# Altium schematic sheet STM32 Sematik.SchDoc
size A4; SheetNumber: 3; SheetTotal: 7
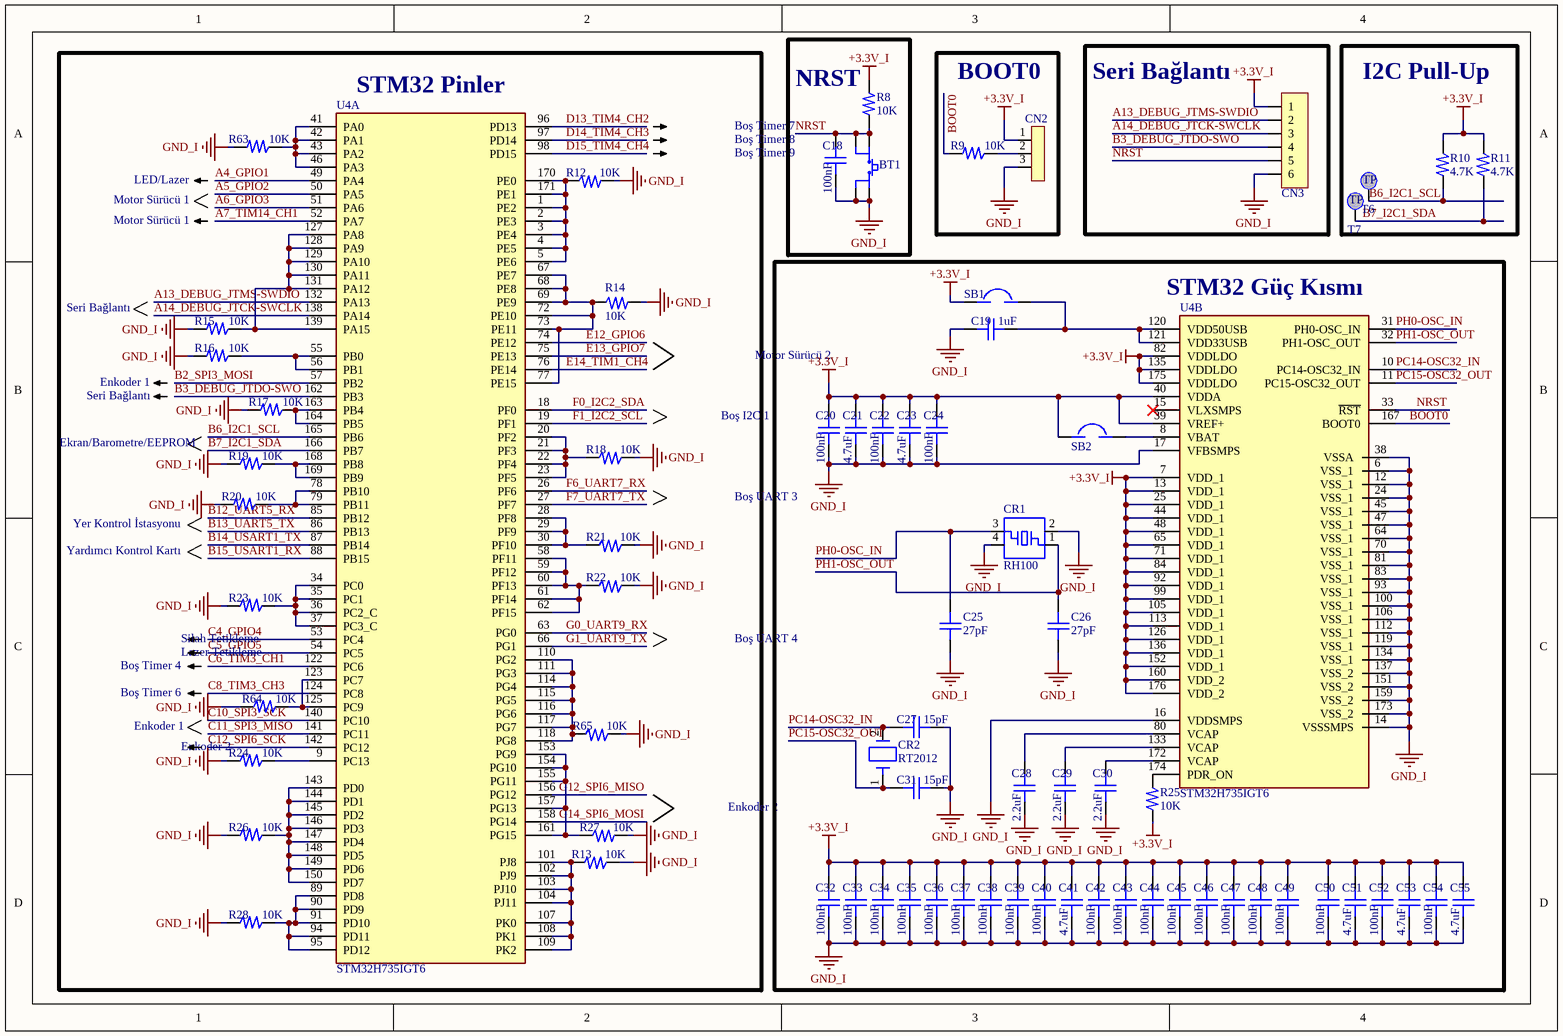
[diagram p0: STM32 Sematik.SchDoc]

## Parts
BT1  5_mm_Buton  [5mm_buton]  (value not drawn)
C18  100nF  [0805 Kapasıtor]
C19  1uF  [0805 Kapasıtor]
C20  100nF  [0805 Kapasıtor]
C21  4.7uF  [0805 Kapasıtor]
C22  100nF  [0805 Kapasıtor]
C23  4.7uF  [0805 Kapasıtor]
C24  100nF  [0805 Kapasıtor]
C25  27pF  [0805 Kapasıtor]
C26  27pF  [0805 Kapasıtor]
C27  15pF  [0805 Kapasıtor]
C28  2.2uF  [0805 Kapasıtor]
C29  2.2uF  [0805 Kapasıtor]
C30  2.2uF  [0805 Kapasıtor]
C31  15pF  [0805 Kapasıtor]
C32  100nF  [0805 Kapasıtor]
C33  100nF  [0805 Kapasıtor]
C34  100nF  [0805 Kapasıtor]
C35  100nF  [0805 Kapasıtor]
C36  100nF  [0805 Kapasıtor]
C37  100nF  [0805 Kapasıtor]
C38  100nF  [0805 Kapasıtor]
C39  100nF  [0805 Kapasıtor]
C40  100nF  [0805 Kapasıtor]
C41  4.7uF  [0805 Kapasıtor]
C42  100nF  [0805 Kapasıtor]
C43  100nF  [0805 Kapasıtor]
C44  100nF  [0805 Kapasıtor]
C45  100nF  [0805 Kapasıtor]
C46  100nF  [0805 Kapasıtor]
C47  100nF  [0805 Kapasıtor]
C48  100nF  [0805 Kapasıtor]
C49  100nF  [0805 Kapasıtor]
C50  100nF  [0805 Kapasıtor]
C51  4.7uF  [0805 Kapasıtor]
C52  100nF  [0805 Kapasıtor]
C53  4.7uF  [0805 Kapasıtor]
C54  100nF  [0805 Kapasıtor]
C55  4.7uF  [0805 Kapasıtor]
CN2  3_Pin_Header  [3_PIN_HEADER]  (value not drawn)
CN3  6_Pin_JST_Male  [6_Pin_JST_Male]  (value not drawn)
CR1  RH100  [RH100]
CR2  RT2012  [RT2012]
R8  10K  [0805 Dırenc]
R9  10K  [0805 Dırenc]
R10  4.7K  [0805 Dırenc]
R11  4.7K  [0805 Dırenc]
R12  10K  [0805 Dırenc]
R13  10K  [0805 Dırenc]
R14  10K  [0805 Dırenc]
R15  10K  [0805 Dırenc]
R16  10K  [0805 Dırenc]
R17  10K  [0805 Dırenc]
R18  10K  [0805 Dırenc]
R19  10K  [0805 Dırenc]
R20  10K  [0805 Dırenc]
R21  10K  [0805 Dırenc]
R22  10K  [0805 Dırenc]
R23  10K  [0805 Dırenc]
R24  10K  [0805 Dırenc]
R25  10K  [0805 Dırenc]
R26  10K  [0805 Dırenc]
R27  10K  [0805 Dırenc]
R28  10K  [0805 Dırenc]
R63  10K  [0805 Dırenc]
R64  10K  [0805 Dırenc]
R65  10K  [0805 Dırenc]
SB1  Solder_Bridge  [Solder_Bridge]  (value not drawn)
SB2  Solder_Bridge  [Solder_Bridge]  (value not drawn)
T6  Test Noktası  [Test Noktası]  (value not drawn)
T7  Test Noktası  [Test Noktası]  (value not drawn)
U4  STM32H735IGT6  [LQFP-176]  (parts A,B of 2)

## Blocks framed on the sheet
STM32 Pinler: R12-R24 R26-R28 R63-R65 U4
NRST: BT1 C18 R8
BOOT0: CN2 R9
Seri Bağlantı: CN3
I2C Pull-Up: R10 R11 T6 T7
STM32 Güç Kısmı: C19-C55 CR1 CR2 R25 SB1 SB2 U4

## Nets
+3.3V_I: C20.2 C21.2 C22.2 C23.2 C24.2 C32.2 C33.2 C34.2 C35.2 C36.2 C37.2 C38.2 C39.2 C40.2 C41.2 C42.2 C43.2 C44.2 C45.2 C46.2 C47.2 C48.2 C49.2 C50.2 C51.2 C52.2 C53.2 C54.2 C55.2 CN2.1 CN3.1 R8.2 R10.2 R11.2 R25.1 SB1.1 SB2.1 U4.7(VDD_1) U4.13(VDD_1) U4.25(VDD_1) U4.39(VREF+) U4.40(VDDA) U4.44(VDD_1) U4.48(VDD_1) U4.65(VDD_1) U4.71(VDD_1) U4.82(VDDLDO) U4.84(VDD_1) U4.92(VDD_1) U4.99(VDD_1) U4.105(VDD_1) U4.113(VDD_1) U4.126(VDD_1) U4.135(VDDLDO) U4.136(VDD_1) U4.152(VDD_1) U4.160(VDD_2) U4.175(VDDLDO) U4.176(VDD_2)
GND_I: BT1.2 BT1.3 C18.1 C19.1 C20.1 C21.1 C22.1 C23.1 C24.1 C25.1 C26.1 C27.2 C28.1 C29.1 C30.1 C31.2 C32.1 C33.1 C34.1 C35.1 C36.1 C37.1 C38.1 C39.1 C40.1 C41.1 C42.1 C43.1 C44.1 C45.1 C46.1 C47.1 C48.1 C49.1 C50.1 C51.1 C52.1 C53.1 C54.1 C55.1 CN2.3 CN3.6 CR1.2 CR1.4 R12.1 R13.1 R14.1 R15.1 R16.1 R17.1 R18.1 R19.1 R20.1 R21.1 R22.1 R23.1 R24.1 R26.1 R27.1 R28.1 R63.1 R64.1 R65.1 U4.6(VSS_1) U4.12(VSS_1) U4.14(VSSSMPS) U4.16(VDDSMPS) U4.17(VFBSMPS) U4.24(VSS_1) U4.38(VSSA) U4.45(VSS_1) U4.47(VSS_1) U4.64(VSS_1) U4.70(VSS_1) U4.81(VSS_1) U4.83(VSS_1) U4.93(VSS_1) U4.100(VSS_1) U4.106(VSS_1) U4.112(VSS_1) U4.119(VSS_1) U4.134(VSS_1) U4.137(VSS_2) U4.151(VSS_2) U4.159(VSS_2) U4.173(VSS_2)
A4_GPIO1: U4.49(PA4)
A5_GPIO2: U4.50(PA5)
A6_GPIO3: U4.51(PA6)
A7_TIM14_CH1: U4.52(PA7)
A13_DEBUG_JTMS-SWDIO: CN3.2 U4.132(PA13)
A14_DEBUG_JTCK-SWCLK: CN3.3 U4.138(PA14)
B2_SPI3_MOSI: U4.57(PB2)
B3_DEBUG_JTDO-SWO: CN3.4 U4.162(PB3)
B6_I2C1_SCL: R10.1 T6.1 U4.165(PB6)
B7_I2C1_SDA: R11.1 T7.1 U4.166(PB7)
B12_UART5_RX: U4.85(PB12)
B13_UART5_TX: U4.86(PB13)
B14_USART1_TX: U4.87(PB14)
B15_USART1_RX: U4.88(PB15)
BOOT0: R9.1 U4.167(BOOT0)
C4_GPIO4: U4.53(PC4)
C5_GPIO5: U4.54(PC5)
C6_TIM3_CH1: U4.122(PC6)
C8_TIM3_CH3: U4.124(PC8)
C10_SPI3_SCK: U4.140(PC10)
C11_SPI3_MISO: U4.141(PC11)
C12_SPI6_SCK: U4.142(PC12)
D13_TIM4_CH2: U4.96(PD13)
D14_TIM4_CH3: U4.97(PD14)
D15_TIM4_CH4: U4.98(PD15)
E12_GPIO6: U4.74(PE12)
E13_GPIO7: U4.75(PE13)
E14_TIM1_CH4: U4.76(PE14)
F0_I2C2_SDA: U4.18(PF0)
F1_I2C2_SCL: U4.19(PF1)
F6_UART7_RX: U4.26(PF6)
F7_UART7_TX: U4.27(PF7)
G0_UART9_RX: U4.63(PG0)
G1_UART9_TX: U4.66(PG1)
G12_SPI6_MISO: U4.156(PG12)
G14_SPI6_MOSI: U4.158(PG14)
NRST: BT1.1 BT1.4 C18.2 CN3.5 R8.1 U4.33(~{RST})
PC14-OSC32_IN: C27.1 CR2.2 U4.10(PC14-OSC32_IN)
PC15-OSC32_OUT: C31.1 CR2.1 U4.11(PC15-OSC32_OUT)
PH0-OSC_IN: C25.2 CR1.3 U4.31(PH0-OSC_IN)
PH1-OSC_OUT: C26.2 CR1.1 U4.32(PH1-OSC_OUT)
NetC19_2: C19.2 SB1.2 U4.120(VDD50USB) U4.121(VDD33USB)
NetC28_2: C28.2 U4.80(VCAP)
NetC29_2: C29.2 U4.133(VCAP)
NetC30_2: C30.2 U4.172(VCAP)
NetCN2_2: CN2.2 R9.2
NetR12_2: R12.2 U4.1(PE2) U4.2(PE3) U4.3(PE4) U4.4(PE5) U4.5(PE6) U4.170(PE0) U4.171(PE1)
NetR13_2: R13.2 U4.101(PJ8) U4.102(PJ9) U4.103(PJ10) U4.104(PJ11) U4.107(PK0) U4.108(PK1) U4.109(PK2)
NetR14_2: R14.2 U4.67(PE7) U4.68(PE8) U4.69(PE9) U4.72(PE10) U4.73(PE11) U4.77(PE15)
NetR15_2: R15.2 U4.127(PA8) U4.128(PA9) U4.129(PA10) U4.130(PA11) U4.131(PA12) U4.139(PA15)
NetR16_2: R16.2 U4.55(PB0) U4.56(PB1)
NetR17_2: R17.2 U4.163(PB4) U4.164(PB5)
NetR18_2: R18.2 U4.20(PF2) U4.21(PF3) U4.22(PF4) U4.23(PF5)
NetR19_2: R19.2 U4.168(PB8) U4.169(PB9)
NetR20_2: R20.2 U4.78(PB10) U4.79(PB11)
NetR21_2: R21.2 U4.28(PF8) U4.29(PF9) U4.30(PF10)
NetR22_2: R22.2 U4.58(PF11) U4.59(PF12) U4.60(PF13) U4.61(PF14) U4.62(PF15)
NetR23_2: R23.2 U4.34(PC0) U4.35(PC1) U4.36(PC2_C) U4.37(PC3_C)
NetR24_2: R24.2 U4.9(PC13)
NetR25_2: R25.2 U4.174(PDR_ON)
NetR26_2: R26.2 U4.143(PD0) U4.144(PD1) U4.145(PD2) U4.146(PD3) U4.147(PD4) U4.148(PD5) U4.149(PD6) U4.150(PD7)
NetR27_2: R27.2 U4.153(PG9) U4.154(PG10) U4.155(PG11) U4.157(PG13) U4.161(PG15)
NetR28_2: R28.2 U4.89(PD8) U4.90(PD9) U4.91(PD10) U4.94(PD11) U4.95(PD12)
NetR63_2: R63.2 U4.41(PA0) U4.42(PA1) U4.43(PA2) U4.46(PA3)
NetR64_2: R64.2 U4.123(PC7) U4.125(PC9)
NetR65_2: R65.2 U4.110(PG2) U4.111(PG3) U4.114(PG4) U4.115(PG5) U4.116(PG6) U4.117(PG7) U4.118(PG8)
NetSB2_2: SB2.2 U4.8(VBAT)

Not connected (* = marked no-connect by the designer): U4 15(VLXSMPS)*

## Notes on the sheet
- Boş Timer 7
- Boş Timer 8
- Boş Timer 9
- Motor Sürücü 1
- LED/Lazer
- Seri Bağlantı
- Enkoder 1
- Motor Sürücü 2
- Ekran/Barometre/EEPROM
- Boş I2C 1
- Boş UART 3
- Yardımcı Kontrol Kartı
- (near R20) Yer Kontrol İstasyonu
- Lazer Tetikleme
- Silah Tetikleme
- Boş UART 4
- Boş Timer 4
- Boş Timer 6
- Enkoder 2
- (in symbol Test Noktası) TP

## Library data of the parts
C18-C55 = Kapasitor 0805
CN2 = 3_Pin_2.54mm
CR1 = 16_MHz_Crystal
CR2 = RT2012_Kristal
R8-R28 R63-R65 = Direnc 0805
SB1 SB2 = Lehim Köprüsü
U4 = STM32H735IGT6: ARM® Cortex®-M7 STM32H7 Microcontroller IC 32-Bit 550MHz 1MB (1M x 8) FLASH 176-LQFP (24x24); MF: STMicroelectronics; SnapEDA_Link: https://www.snapeda.com/parts/STM32H735IGT6/STMicroelectronics/view-part/?ref=snap; Package: LQFP-176 STMicroelectronics; Value: *; MP: STM32H735IGT6; Check_prices: https://www.snapeda.com/parts/STM32H735IGT6/STMicroelectronics/view-part/?ref=eda